# EAGLE design pulseira2202 (EAGLE 9.7.0)
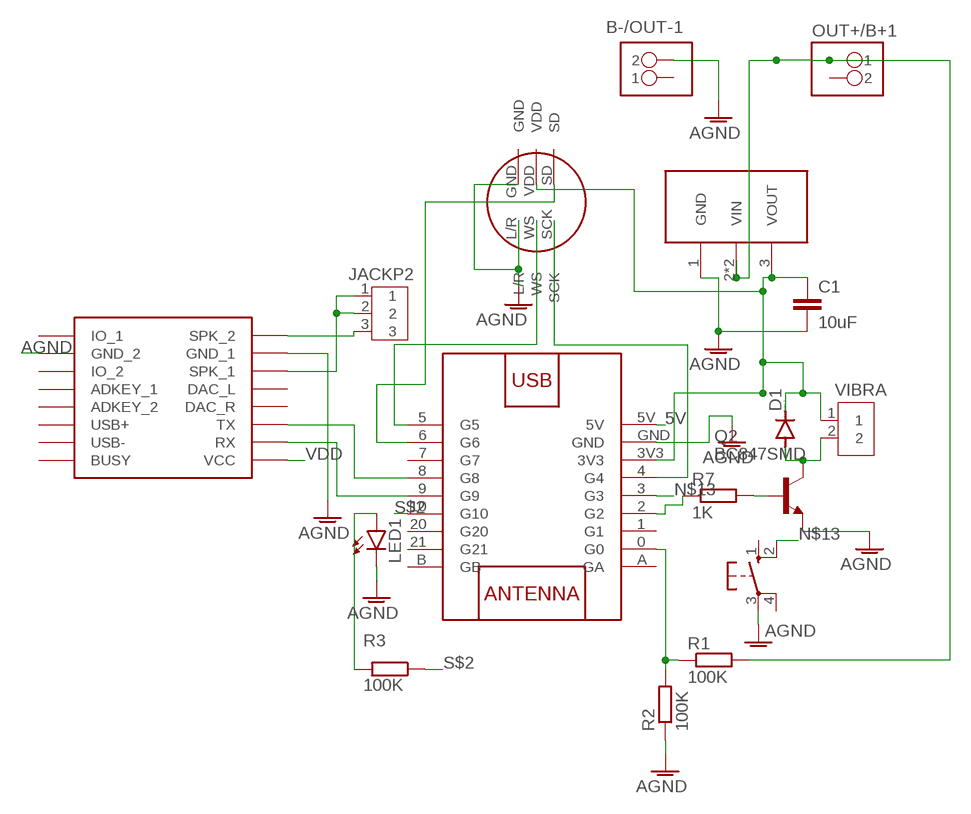
[diagram p0: schematic, sheet 1]

## Parts
B-/OUT-1  PINHD-1X02_1X02M  [1X02]
C1  10uF  C-EUC0805  [C0805]
D1  DIODE-SOD123  [SOD123]
IC1  HT7833  [SOT89]
JACKP2  B3B-XH-A  [B3B-XH-A]
LED1  LED3MM  [LED3MM]
OUT+/B+1  PINHD-1X02_1X02M  [1X02]
Q2  BC847SMD  [SOT23]
R1  100K  R-EU_R0805  [R0805]
R2  100K  R-EU_R0805  [R0805]
R3  100K  R-EU_R0805  [R0805]
R7  1K  R-EU_R0805  [R0805]
S1  10-XX  [B3F-10XX]
U$1  DFPLAYER  [DFPLAYER]
U$2  INMP441_CIRCULAR  [MIC_CIRCULAR]
U$4  ESP32SUPERMINI_ESP32-SUPERMINI  [ESP32SUPERMINI_ESP32-SUPERMINI]
VIBRA  B2B-XH-A  [B2B-XH-A]

## Nets
5V: U$4.5V
AGND: B-/OUT-1.2 C1.2 IC1.1(GND) LED1.K(C) Q2.2(E) R2.1 S1.3(P) U$1.GND_1 U$1.GND_2 U$2.GND U$2.L/R U$4.GND
N$1: U$1.RX U$4.9(G9)
N$3: U$1.TX U$4.8(G8)
N$4: JACKP2.1 JACKP2.2 U$1.SPK1(SPK_1)
N$5: JACKP2.3 U$1.SPK2(SPK_2)
N$6: Q2.1(B) R7.2
N$7: R7.1 U$4.2(G2)
N$9: D1.A Q2.3(C) VIBRA.2
N$10: U$2.WS U$4.5(G5)
N$11: U$2.SCK U$4.4(G4)
N$12: U$2.SD U$4.6(G6)
N$13: S1.2(S1) U$4.3(G3)
N$14: IC1.2(VIN) IC1.2@1(VIN) OUT+/B+1.1 R1.2
N$15: R1.1 R2.2 U$4.0(G0)
S$1: LED1.A R3.2
S$2: R3.1 U$4.10(G10)
VDD: C1.1 D1.C IC1.3(VOUT) U$1.VCC U$2.VDD U$4.3V3 VIBRA.1
Unconnected: B-/OUT-1.1 OUT+/B+1.2 S1.1(S) S1.4(P1) U$1.ADKEY1(ADKEY_1) U$1.ADKEY2(ADKEY_2) U$1.BUSY U$1.DAC_L U$1.DAC_R U$1.IO1(IO_1) U$1.IO2(IO_2) U$1.USB+ U$1.USB- U$4.1(G1) U$4.7(G7) U$4.20(G20) U$4.21(G21) U$4.A(GA) U$4.B(GB)

## Library data of the parts
B-/OUT-1 OUT+/B+1 = Tinkercad:PINHD-1X02
C1 = rcl:C-EU: CAPACITOR, European symbol; SPICEPREFIX: C
D1 = diode:DIODE-: DIODE
IC1 = HT7833:HT7833: Check availability <https://pricing.snapeda.com/parts/HT7833/Multicomp%20Pro/view-part?ref=eda>; AVAILABILITY: In Stock; CHECK_PRICES: https://www.snapeda.com/parts/HT7833/Multicomp/view-part/?ref=eda; DESCRIPTION: Ldo, High Input Voltage, 3.3V, Sot-89 |Multicomp Pro HT7833; MF: Multicomp Pro; MP: HT7833; PACKAGE: None; PRICE: None; SNAPEDA_LINK: https://www.snapeda.com/parts/HT7833/Multicomp/view-part/?ref=snap
JACKP2 = Connector:B3B-XH-A: XH Connector Top Entry - 3POS Details see: Datasheet <http://www.jst-mfg.com/product/pdf/eng/eXH.pdf>; CATEGORY: Header; DATASHEET: https://www.jst-mfg.com/product/pdf/eng/eXH.pdf?67404de0bbae1; DESCRIPTION: Connector Header Through Hole 3 position 0.098" (2.50mm); MANUFACTURER: JST Sales America Inc.; MPN: B3B-XH-A; OPERATING_TEMPERATURE: -25°C ~ 85°C; PACKAGE_SIZE: NA; PACKAGE_TYPE: THT; PART_STATUS: ACTIVE; PITCH: 0.098" (2.50mm); ROHS: COMPLIANT; SERIES: XH; SUBCATEGORY: Rectangular Connectors; TYPE: Header-Male Pin-Board to Cable/Wire-Through Hole
LED1 = led:LED: LED OSRAM: - CHIPLED LG R971, LG N971, LY N971, LG Q971, LY Q971, LO R971, LY R971 LH N974, LH R974 LS Q976, LO Q976, LY Q976 LO Q996 - Hyper CHIPLED LW Q18S LB Q993, LB Q99A, LB R99A - SideLED LS A670, LO A670, LY A670, LG A670, LP A670 LB A673, LV A673, LT A673, LW A673 LH A674 LY A675 LS A676, LA A676, LO A676, LY A676, LW A676 LS A679, LY A679, LG A679 - Hyper Micro SIDELED® LS Y876, LA Y876, LO Y876, LY Y876 LT Y87S - SmartLED LW L88C, LW L88S LB L89C, LB L89S, LG L890 LS L89K, LO L89K, LY L89K LS L896, LA L896, LO L896, LY L896 - TOPLED LS T670, LO T670, LY T670, LG T670, LP T670 LSG T670, LSP T670, LSY T670, LOP T670, LYG T670 LG T671, LOG T671, LSG T671 LB T673, LV T673, LT T673, LW T673 LH T674 LS T676, LA T676, LO T676, LY T676, LB T676, LH T676, LSB T676, LW T676 LB T67C, LV T67C, LT T67C, LS T67K, LO T67K, LY T67K, LW E67C LS E67B, LA E67B, LO E67B, LY E67B, LB E67C, LV E67C, LT E67C LW T67C LS T679, LY T679, LG T679 LS T770, LO T770, LY T770, LG T770, LP T770 LB T773, LV T773, LT T773, LW T773 LH T774 LS E675, LA E675, LY E675, LS T675 LS T776, LA T776, LO T776, LY T776, LB T776 LHGB T686 LT T68C, LB T68C - Hyper Mini TOPLED® LB M676 - Mini TOPLED Santana® LG M470 LS M47K, LO M47K, LY M47K Source: http://www.osram.convergy.de LUXEON: - LUMILED® LXK2-PW12-R00, LXK2-PW12-S00, LXK2-PW14-U00, LXK2-PW14-V00 LXK2-PM12-R00, LXK2-PM12-S00, LXK2-PM14-U00 LXK2-PE12-Q00, LXK2-PE12-R00, LXK2-PE12-S00, LXK2-PE14-T00, LXK2-PE14-U00 LXK2-PB12-K00, LXK2-PB12-L00, LXK2-PB12-M00, LXK2-PB14-N00, LXK2-PB14-P00, LXK2-PB14-Q00 LXK2-PR12-L00, LXK2-PR12-M00, LXK2-PR14-Q00, LXK2-PR14-R00 LXK2-PD12-Q00, LXK2-PD12-R00, LXK2-PD12-S00 LXK2-PH12-R00, LXK2-PH12-S00 LXK2-PL12-P00, LXK2-PL12-Q00, LXK2-PL12-R00 Source: www.luxeon.com KINGBRIGHT: KA-3528ASYC Source: www.kingbright.com
Q2 = transistor-npn:BC847*: NPN Transistor
R1-R3 R7 = rcl:R-EU_: RESISTOR, European symbol; SPICEPREFIX: R
S1 = switch-omron:10-XX: OMRON SWITCH; MPN: B3F-1000; OC_FARNELL: 176432; OC_NEWARK: 36M3542
U$1 = DFPlayer_v1:DFPLAYER
U$2 = MIC_CIRCULAR:INMP441_CIRCULAR
U$4 = ESP32C3supermini:ESP32SUPERMINI_ESP32-SUPERMINI: WEMOS D1 mini: Mini Wi-Fi Board based on ESP-8266 device More details can be found here: https://www.wemos.cc/product/d1-mini.html Click here to find device on ebay.com <http://www.ebay.com/sch/wemos+d1+mini+nodemcu>
VIBRA = Connector:B2B-XH-A: XH Connector Top Entry - 2POS Details see: Datasheet <http://www.jst-mfg.com/product/pdf/eng/eXH.pdf>; CATEGORY: Header; DATASHEET: https://www.jst-mfg.com/product/pdf/eng/eXH.pdf?67404de0bbae1; DESCRIPTION: Connector Header Through Hole 2 position 0.098" (2.50mm); MANUFACTURER: JST Sales America Inc.; MPN: B2B-XH-A; OPERATING_TEMPERATURE: -25°C ~ 85°C; PACKAGE_SIZE: NA; PACKAGE_TYPE: THT; PART_STATUS: ACTIVE; PITCH: 0.098" (2.50mm); ROHS: COMPLIANT; SERIES: XH; SUBCATEGORY: Rectangular Connectors; TYPE: Header-Male Pin-Board to Cable/Wire-Through Hole

## Board
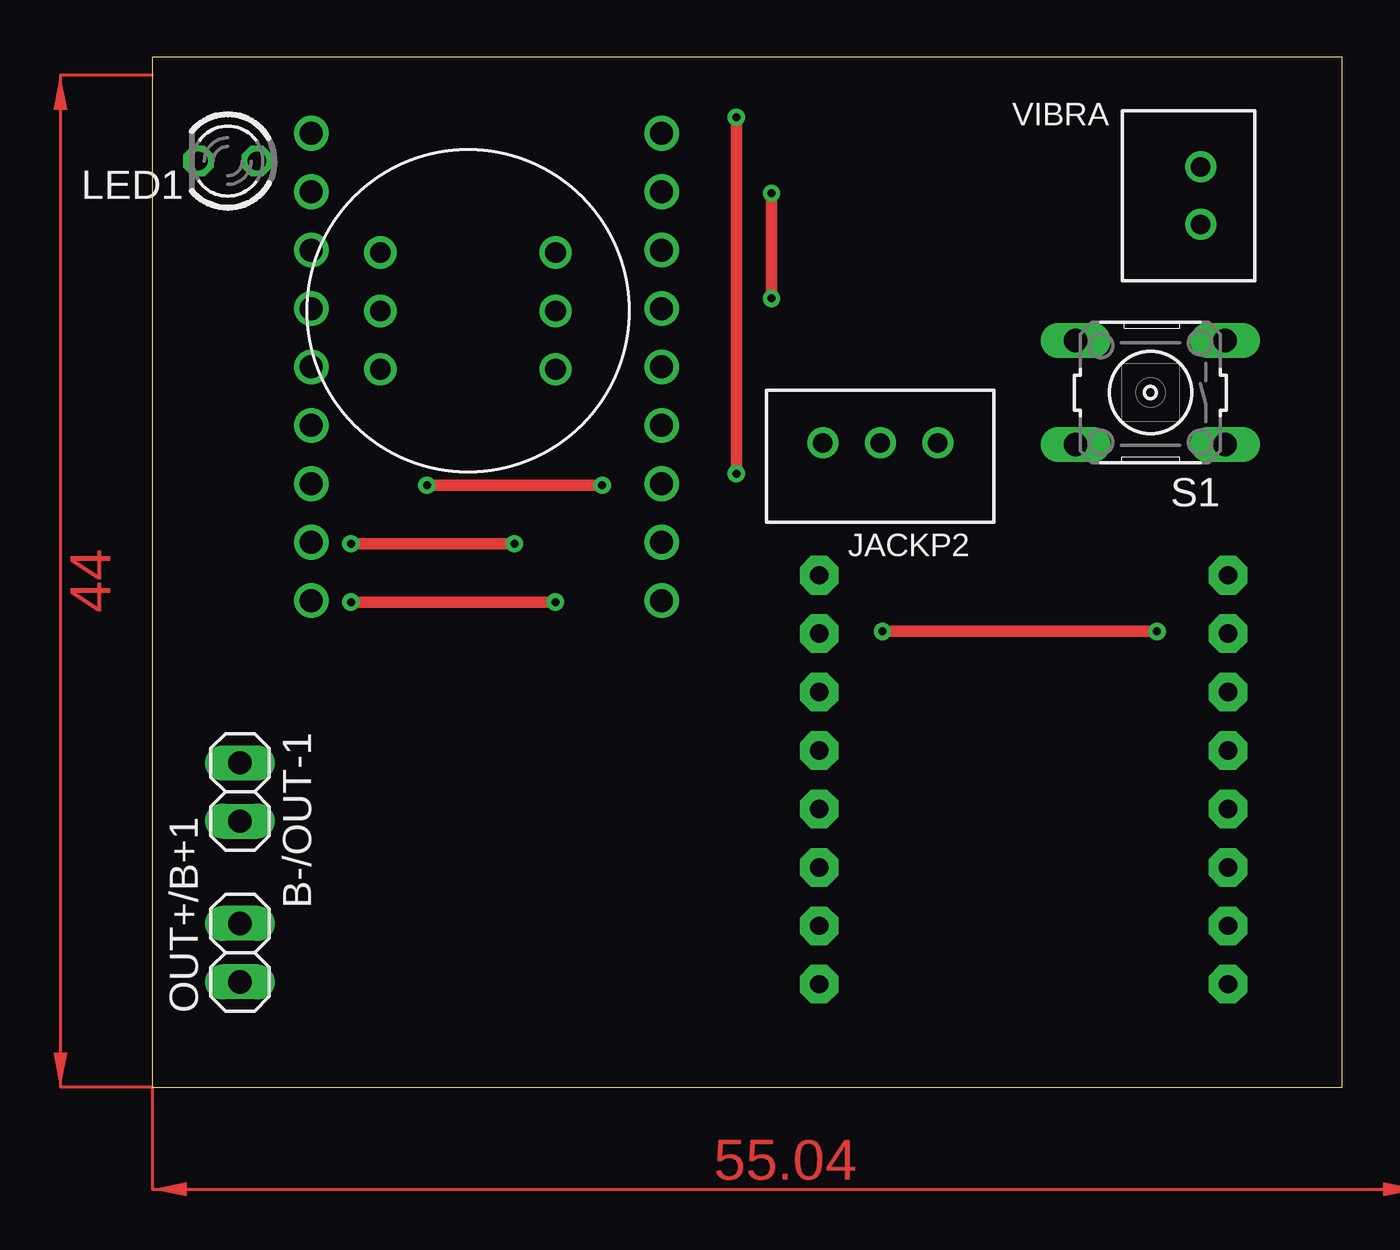
[diagram p1: board, top side]
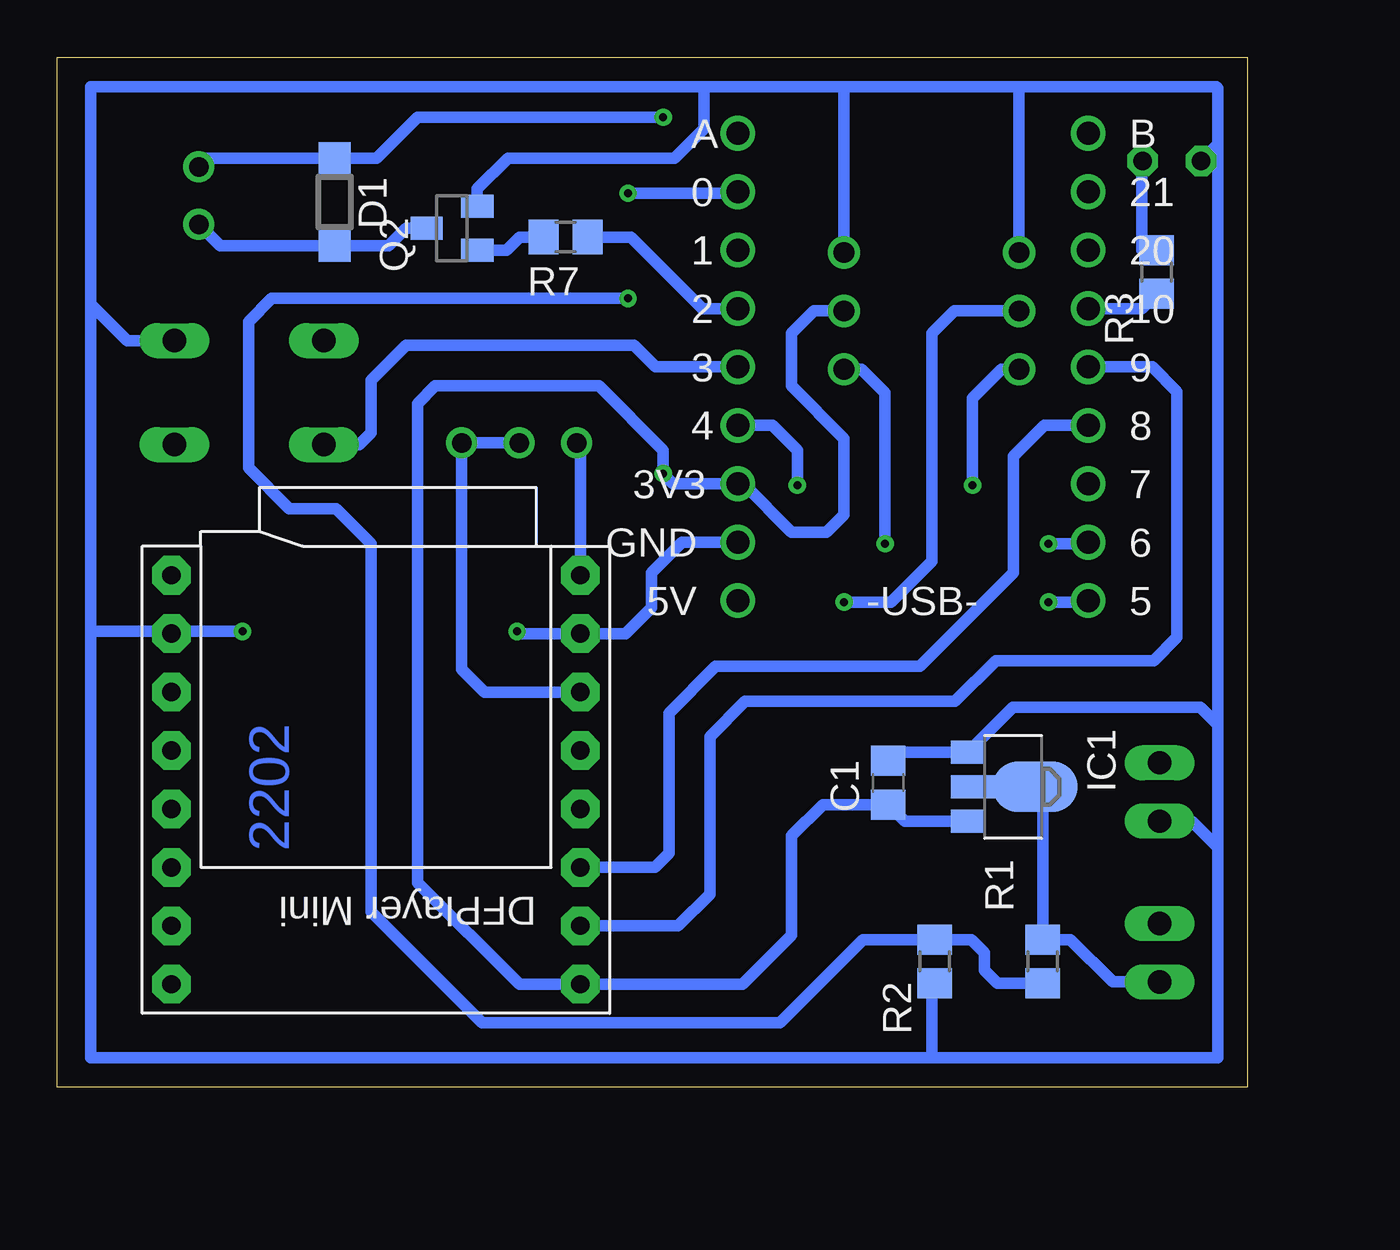
[diagram p2: board, bottom side, seen from below]

Size 51.74 x 44.76 mm. Coordinates in mm from the lower left corner, seen from the top.
Outline: 0,0 51.74,0 51.74,44.76 0,44.76 0,0
Copper layers (1*16): Top 0.035mm / dielectric 1.5mm / Bottom 0.035mm
Design rules "Fusion Electronics Design Rules": minimum track width 6mil, minimum drill 0.35mm, track to track 6mil, track to pad 6mil, pad to pad 6mil, via to via 6mil, smd to smd 6mil, copper to edge 40mil, drill to drill 6mil, minimum pad ring 10mil, minimum via ring 8mil, stop-mask expansion 4mil, vias tented up to drill 9999mil, thermal gap 10mil

### Footprints (pad centres in the part's own frame; a part is rotated, then mirrored left to right if it is on the bottom)
1X02 = drill 1.016 long: 1 -1.27,0; 2 1.27,0
C0805 = smd 1.3 x 1.5: 1 -0.95,0; 2 0.95,0
SOD123 = smd 1.4 x 1.4: A 1.9,0; C -1.9,0
SOT89 = smd 1 x 1.5: 1 -1.499,-1.981; 3 1.499,-1.981 | smd 1 x 2: 2 0,-1.727 | smd 2.2 x 3.7: 2@1 0,0.94
B3B-XH-A = drill 0.84: 1 0,0; 2 2.5,0; 3 5,0
LED3MM = drill 0.813 octagon: A -1.27,0; K 1.27,0
SOT23 = smd 1 x 1.4: 1 -0.95,-1.1; 2 0.95,-1.1; 3 0,1.1
R0805 = smd 1.3 x 1.5: 1 -0.95,0; 2 0.95,0
B3F-10XX = drill 1.016 long: 1 -3.251,2.261; 2 3.251,2.261; 3 -3.251,-2.261; 4 3.251,-2.261
DFPLAYER = drill 0.8 pad 1.676 octagon: ADKEY1 8.89,-1.27; ADKEY2 8.89,1.27; BUSY 8.89,8.89; DAC_L -8.89,-1.27; DAC_R -8.89,1.27; GND_1 -8.89,-6.35; GND_2 8.89,-6.35; IO1 8.89,-8.89; IO2 8.89,-3.81; RX -8.89,6.35; SPK1 -8.89,-3.81; SPK2 -8.89,-8.89; TX -8.89,3.81; USB+ 8.89,3.81; USB- 8.89,6.35; VCC -8.89,8.89
MIC_CIRCULAR = drill 0.9: GND -2.54,3.81; L/R -2.54,-3.81; SCK 2.54,-3.81; SD 2.54,3.81; VDD 0,3.81; WS 0,-3.81
ESP32SUPERMINI_ESP32-SUPERMINI = drill 1: 0 -11.43,9.525; 1 -11.43,6.985; 2 -11.43,4.445; 3 -11.43,1.905; 3V3 -11.43,-3.175; 4 -11.43,-0.635; 5 3.81,-8.255; 5V -11.43,-8.255; 6 3.81,-5.715; 7 3.81,-3.175; 8 3.81,-0.635; 9 3.81,1.905; 10 3.81,4.445; 20 3.81,6.985; 21 3.81,9.525; A -11.43,12.065; B 3.81,12.065; GND -11.43,-5.715
B2B-XH-A = drill 0.84: 1 0,0; 2 2.5,0

### Placement (x,y rotation side)
B-/OUT-1  3.81,12.83 270 top
C1  15.61,13.23 90 bottom
D1  39.69,38.48 270 bottom
IC1  10.16,13.05 270 bottom
JACKP2  34.16,28 180 top
LED1  3.28,40.26 180 top
OUT+/B+1  3.81,5.84 90 top
Q2  34.58,37.34 90 bottom
R1  8.89,5.46 90 bottom
R2  13.59,5.46 90 bottom
R3  3.94,35.43 90 bottom
R7  29.64,36.96 180 bottom
S1  43.41,30.19 180 top
U$1  37.89,13.36 180 bottom
U$2  13.73,33.75 270 top
U$4  10.72,29.4 0 bottom
VIBRA  45.59,40.01 270 top

### Tracks (layer width: path | path; a pad name or v marks a point on that pad's centre or on a via)
AGND  (via drill 0.35)
  Top 0.508: v43.69,19.81 v31.75,19.81
  Bottom 0.508: 25.91,43.49 50.29,43.49 50.29,34.04 | 25.91,43.49 23.62,43.49 | 23.62,43.49 18.29,43.49 | 18.29,43.49 17.53,43.49 | 17.53,43.49 9.91,43.49 | 9.91,43.49 1.33,43.49 1.27,43.43 1.27,41 | 25.92,43.48 25.91,43.49 | 18.3,43.48 18.29,43.49 | B-/OUT-1.2 2.41,11.56 1.27,10.41 | 1.27,10.41 1.27,1.27 13.72,1.27 | 13.72,1.27 50.29,1.27 50.29,19.81 | C1.2 15.54,14.18 15.17,14.55 IC1.1 10.18,16.51 2.03,16.51 1.27,15.75 | 1.27,10.41 1.27,15.75 | R2.1 13.72,4.38 13.72,1.27 | LED1.K 1.27,41 | 1.27,15.75 1.27,41 | U$2.GND 17.53,36.3 17.53,43.49 | U$4.GND 24.57,23.69 25.91,22.35 25.91,20.83 27.03,19.71 U$1.GND_1 31.65,19.71 v31.75,19.81 | v43.69,19.81 46.68,19.81 U$1.GND_2 46.88,19.81 50.29,19.81 | S1.3 48.71,32.45 50.29,34.04 | U$2.L/R 9.91,43.48 9.91,43.49 | 50.29,19.81 50.29,34.04 | Q2.2 33.48,39.05 32.14,40.39 24.89,40.39 23.62,41.66 23.62,43.49
N$1
  Bottom 0.508: U$1.RX 24.74,7.01 23.37,8.38 23.37,15.24 21.84,16.76 12.7,16.76 10.92,18.54 4.06,18.54 3.05,19.56 3.05,30.23 4.13,31.31 | U$4.9 4.13,31.31 | 4.13,31.31 4.06,31.24
N$3
  Bottom 0.508: U$4.8 8.82,28.77 10.16,27.43 10.16,22.35 14.22,18.29 23.11,18.29 25.15,16.26 25.15,10.16 25.76,9.55 U$1.TX
N$4
  Bottom 0.508: U$1.SPK1 33.17,17.17 34.16,18.16 JACKP2.1 JACKP2.2
N$5
  Bottom 0.508: U$1.SPK2 29,27.84 JACKP2.3
N$6
  Bottom 0.508: 30.94,37.31 R7.2 | 30.72,36.83 R7.2 | Q2.1 32.21,36.39 31.64,36.96 R7.2
N$7
  Bottom 0.508: 28.63,36.9 R7.1 26.8,36.96 23.69,33.85 U$4.2
N$9
  Bottom 0.508: VIBRA.2 44.67,36.58 D1.A 37.34,36.58 36.58,37.34 Q2.3
N$10  (via drill 0.35)
  Top 0.508: v8.64,21.08 v17.53,21.08
  Bottom 0.508: U$4.5 6.91,21.08 v8.64,21.08 | v17.53,21.08 15.49,21.08 13.72,22.86 13.72,32.77 12.74,33.75 U$2.WS
N$11  (via drill 0.35)
  Top 0.508: v19.56,26.16 v11.94,26.16
  Bottom 0.508: U$2.SCK 10.68,31.21 11.94,29.95 v11.94,26.16 | v19.56,26.16 19.56,27.69 20.64,28.77 U$4.4
N$12  (via drill 0.35)
  Top 0.508: v8.64,23.62 v15.75,23.62
  Bottom 0.508: U$4.6 7.05,23.69 7.11,23.62 v8.64,23.62 | v15.75,23.62 15.75,30.18 16.77,31.21 U$2.SD
N$13
  Bottom 0.508: U$4.3 25.72,31.31 26.67,32.26 36.58,32.26 38.1,30.73 38.1,28.45 38.62,27.93 S1.2
N$14
  Bottom 0.508: OUT+/B+1.1 5.84,4.57 7.68,6.41 R1.2 8.89,12.72 IC1.2@1 IC1.2
N$15  (via drill 0.35)
  Top 0.508: v26.92,38.86 v26.92,34.29
  Bottom 0.508: R1.1 10.86,4.51 11.43,5.08 11.43,5.84 12,6.41 R2.2 16.7,6.41 20.32,2.79 33.27,2.79 38.1,7.62 38.1,23.62 39.62,25.15 41.66,25.15 43.43,26.92 43.43,33.27 42.42,34.29 v26.92,34.29 | v26.92,38.86 22.22,38.86 U$4.0
S$1
  Bottom 0.508: R3.2 4.57,36.38 4.57,40.23 LED1.A
S$2
  Bottom 0.508: U$4.10 4.57,33.85 R3.1
VDD  (via drill 0.35)
  Top 0.508: v25.4,42.16 v25.4,26.67
  Bottom 0.508: IC1.3 14.88,11.55 C1.1 18.46,12.28 19.81,10.92 19.81,6.6 21.95,4.47 U$1.VCC 31.65,4.47 36.07,8.89 36.07,29.72 35.31,30.48 28.19,30.48 25.4,27.69 v25.4,26.67 24.96,26.23 U$4.3V3 21.91,26.23 19.81,24.13 18.29,24.13 17.53,24.89 17.53,28.19 19.81,30.48 19.81,32.77 18.83,33.75 U$2.VDD | VIBRA.1 45.22,40.38 D1.C 37.85,40.38 36.07,42.16 v25.4,42.16
(copper drawn outside any net)
  shapes: Top area x2

### Text on the board
Bottom: 2202